# EAGLE schematic Skematik LED 8X8 (EAGLE 9.6.1)
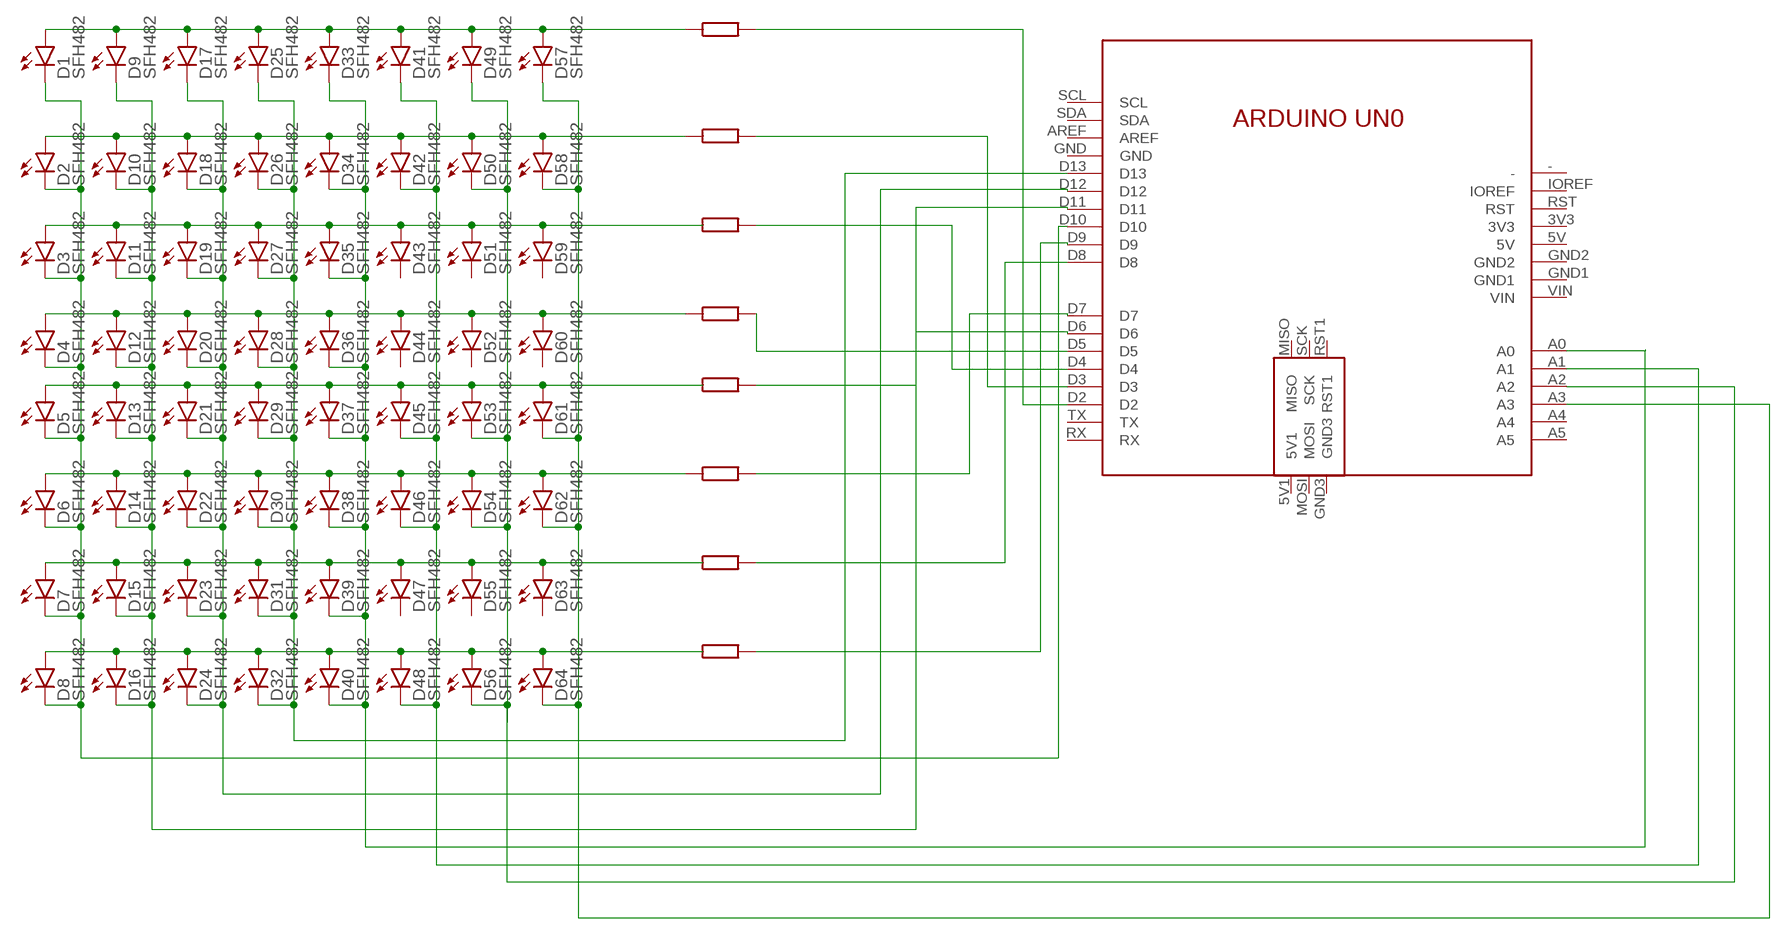
[diagram p0: schematic, sheet 1]

## Parts
D1  SFH482  [SFH482]
D2  SFH482  [SFH482]
D3  SFH482  [SFH482]
D4  SFH482  [SFH482]
D5  SFH482  [SFH482]
D6  SFH482  [SFH482]
D7  SFH482  [SFH482]
D8  SFH482  [SFH482]
D9  SFH482  [SFH482]
D10  SFH482  [SFH482]
D11  SFH482  [SFH482]
D12  SFH482  [SFH482]
D13  SFH482  [SFH482]
D14  SFH482  [SFH482]
D15  SFH482  [SFH482]
D16  SFH482  [SFH482]
D17  SFH482  [SFH482]
D18  SFH482  [SFH482]
D19  SFH482  [SFH482]
D20  SFH482  [SFH482]
D21  SFH482  [SFH482]
D22  SFH482  [SFH482]
D23  SFH482  [SFH482]
D24  SFH482  [SFH482]
D25  SFH482  [SFH482]
D26  SFH482  [SFH482]
D27  SFH482  [SFH482]
D28  SFH482  [SFH482]
D29  SFH482  [SFH482]
D30  SFH482  [SFH482]
D31  SFH482  [SFH482]
D32  SFH482  [SFH482]
D33  SFH482  [SFH482]
D34  SFH482  [SFH482]
D35  SFH482  [SFH482]
D36  SFH482  [SFH482]
D37  SFH482  [SFH482]
D38  SFH482  [SFH482]
D39  SFH482  [SFH482]
D40  SFH482  [SFH482]
D41  SFH482  [SFH482]
D42  SFH482  [SFH482]
D43  SFH482  [SFH482]
D44  SFH482  [SFH482]
D45  SFH482  [SFH482]
D46  SFH482  [SFH482]
D47  SFH482  [SFH482]
D48  SFH482  [SFH482]
D49  SFH482  [SFH482]
D50  SFH482  [SFH482]
D51  SFH482  [SFH482]
D52  SFH482  [SFH482]
D53  SFH482  [SFH482]
D54  SFH482  [SFH482]
D55  SFH482  [SFH482]
D56  SFH482  [SFH482]
D57  SFH482  [SFH482]
D58  SFH482  [SFH482]
D59  SFH482  [SFH482]
D60  SFH482  [SFH482]
D61  SFH482  [SFH482]
D62  SFH482  [SFH482]
D63  SFH482  [SFH482]
D64  SFH482  [SFH482]
U$1  ARDUINO_UNO  [ARDUINO_UNO]

## Nets
N$1: D1.A D9.A D17.A D25.A D33.A D41.A D49.A D57.A
N$2: D2.A D10.A D18.A D26.A D34.A D42.A D50.A D58.A
N$3: D3.A D11.A D19.A D27.A D35.A D43.A D51.A D59.A
N$4: D4.A D12.A D20.A D28.A D36.A D44.A D52.A D60.A
N$5: D5.A D13.A D21.A D29.A D37.A D45.A D53.A D61.A
N$6: D6.A D14.A D22.A D30.A D38.A D46.A D54.A D62.A
N$7: D7.A D15.A D23.A D31.A D39.A D47.A D55.A D63.A
N$8: D8.A D16.A D24.A D32.A D40.A D48.A D56.A D64.A
N$9: D1.K(C) D2.K(C) D3.K(C) D4.K(C) D5.K(C) D6.K(C) D7.K(C) D8.K(C) U$1.D10
N$10: D9.K(C) D10.K(C) D11.K(C) D12.K(C) D13.K(C) D14.K(C) D15.K(C) D16.K(C) U$1.D11
N$11: D17.K(C) D18.K(C) D19.K(C) D20.K(C) D21.K(C) D22.K(C) D23.K(C) D24.K(C) U$1.D12
N$12: D25.K(C) D26.K(C) D27.K(C) D28.K(C) D29.K(C) D30.K(C) D31.K(C) D32.K(C) U$1.D13
N$13: D33.K(C) D34.K(C) D35.K(C) D36.K(C) D37.K(C) D38.K(C) D39.K(C) D40.K(C) U$1.A0
N$14: D41.K(C) D42.K(C) D45.K(C) D46.K(C) D48.K(C) U$1.A1
N$15: D49.K(C) D50.K(C) D53.K(C) D54.K(C) D56.K(C) U$1.A2
N$16: D57.K(C) D58.K(C) D61.K(C) D62.K(C) D64.K(C) U$1.A3
N$17: U$1.D2
N$18: U$1.D9
N$19: U$1.D8
N$20: U$1.D7
N$21: U$1.D3
N$22: U$1.D4
N$23: U$1.D5
N$24: U$1.D6
Unconnected: D43.K(C) D44.K(C) D47.K(C) D51.K(C) D52.K(C) D55.K(C) D59.K(C) D60.K(C) D63.K(C) U$1.3V3 U$1.5V U$1.5V1 U$1.- U$1.A4 U$1.A5 U$1.AREF U$1.GND U$1.GND1 U$1.GND2 U$1.GND3 U$1.IOREF U$1.MISO U$1.MOSI U$1.RST U$1.RST1 U$1.RX U$1.SCK U$1.SCL U$1.SDA U$1.TX U$1.VIN

## Library data of the parts
D1-D64 = led:SFH482: IR LED infrared emitting diode, Infineon
U$1 = ARDUINO_UNO:ARDUINO_UNO: Arduino UNO Created by Aadesh Borate Features : Microcontroller ATmega328P Operating Voltage (logic level) = 5 V Input Voltage (Recommended) = 7-12 V Digital I/O Pins : 14 (out of which 6 provide PWM Output) Analog Input Pins = 6 DC Current per I/O Pin = 20 mA Flash Memory 32 KB (ATmega328) of which 0.5 KB KB used by bootloader SRAM: 2 KB (ATmega328) EEPROM: 1 KB (ATmega328) Clock Speed: 16 MHz Dimensions = 68.6 mm × 53.4 mm Buy this module at Robu.in <https://robu.in/product/arduino-uno-r3/> <